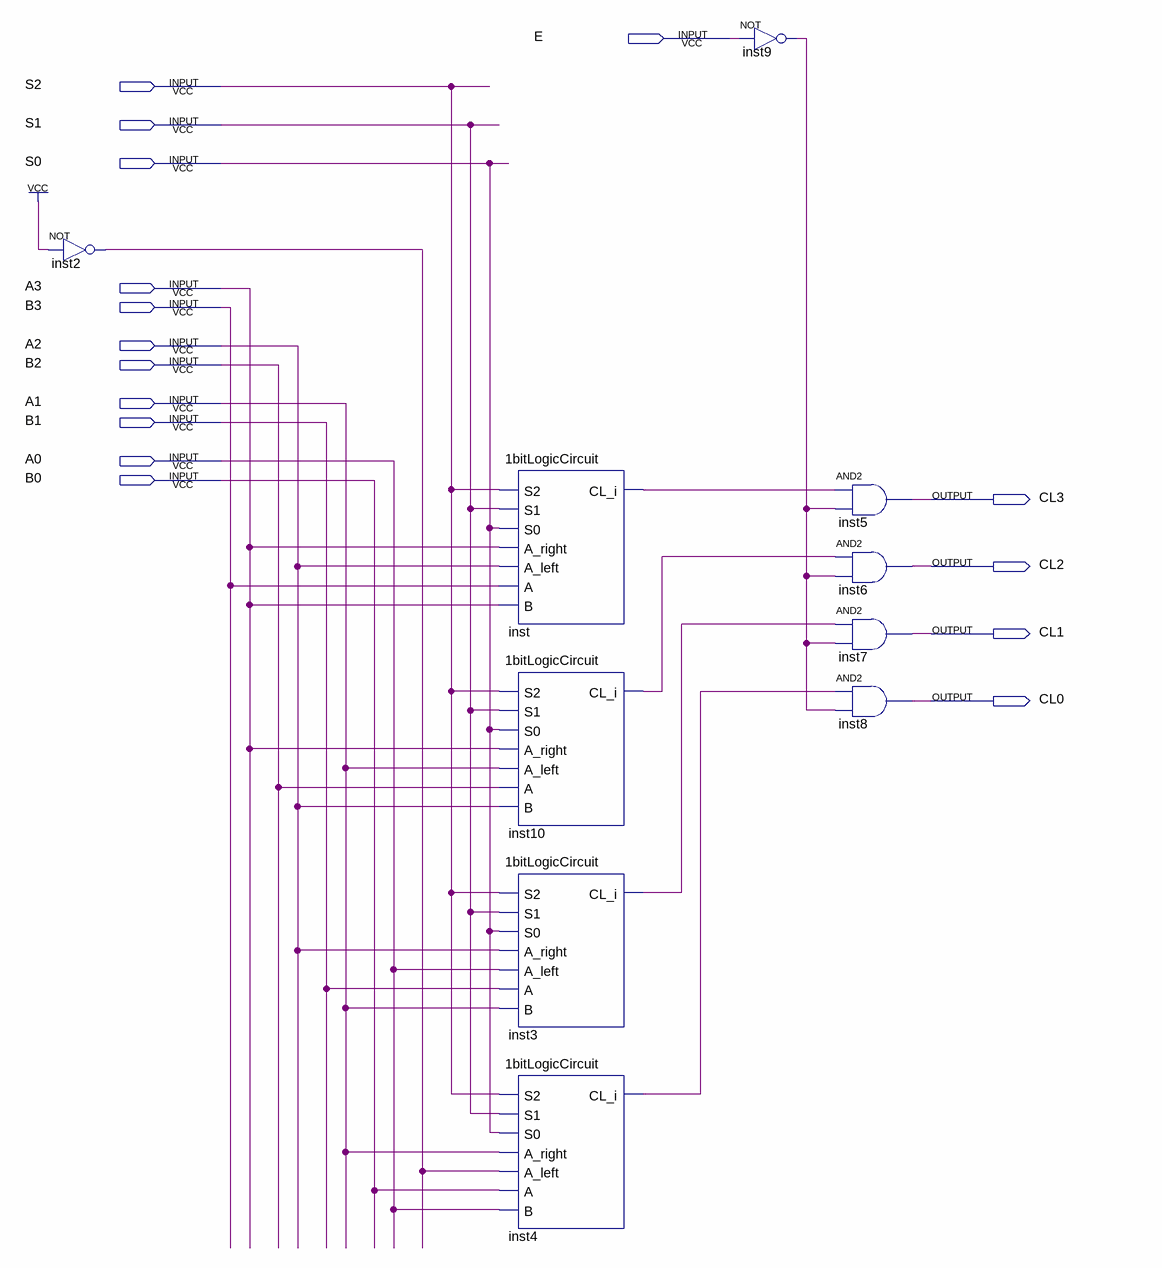
[diagram p0: schematic sheet]
// Quartus schematic 4bitLogicCircuit.bdf as structural Verilog: 10 symbols, 16 pins
module \4bitLogicCircuit  (
  input  E,
  input  S2,
  input  S1,
  input  S0,
  input  A3,
  input  B3,
  input  A2,
  input  B2,
  input  A1,
  input  B1,
  input  A0,
  input  B0,
  output CL3,
  output CL2,
  output CL1,
  output CL0
);

  wire inst2_out, inst3_cl_i, inst4_cl_i, inst9_out, inst10_cl_i, inst_cl_i;

  not inst2 (inst2_out, 1'b1);
  \1bitLogicCircuit  inst (.S2(S2), .S1(S1), .S0(S0), .A_right(A3), .A_left(A2), .A(B3), .B(A3), .CL_i(inst_cl_i));
  \1bitLogicCircuit  inst10 (.S2(S2), .S1(S1), .S0(S0), .A_right(A3), .A_left(A1), .A(B2), .B(A2), .CL_i(inst10_cl_i));
  \1bitLogicCircuit  inst3 (.S2(S2), .S1(S1), .S0(S0), .A_right(A2), .A_left(A0), .A(B1), .B(A1), .CL_i(inst3_cl_i));
  \1bitLogicCircuit  inst4 (
    .S2(S2), .S1(S1), .S0(S0), .A_right(A1), .A_left(inst2_out), .A(B0), .B(A0), .CL_i(inst4_cl_i));
  not inst9 (inst9_out, E);
  and inst5 (CL3, inst_cl_i, inst9_out);
  and inst6 (CL2, inst10_cl_i, inst9_out);
  and inst7 (CL1, inst3_cl_i, inst9_out);
  and inst8 (CL0, inst4_cl_i, inst9_out);
endmodule
